# Altium schematic sheet Watt.SchDoc
size A4; SheetNumber: 1; SheetTotal: 1
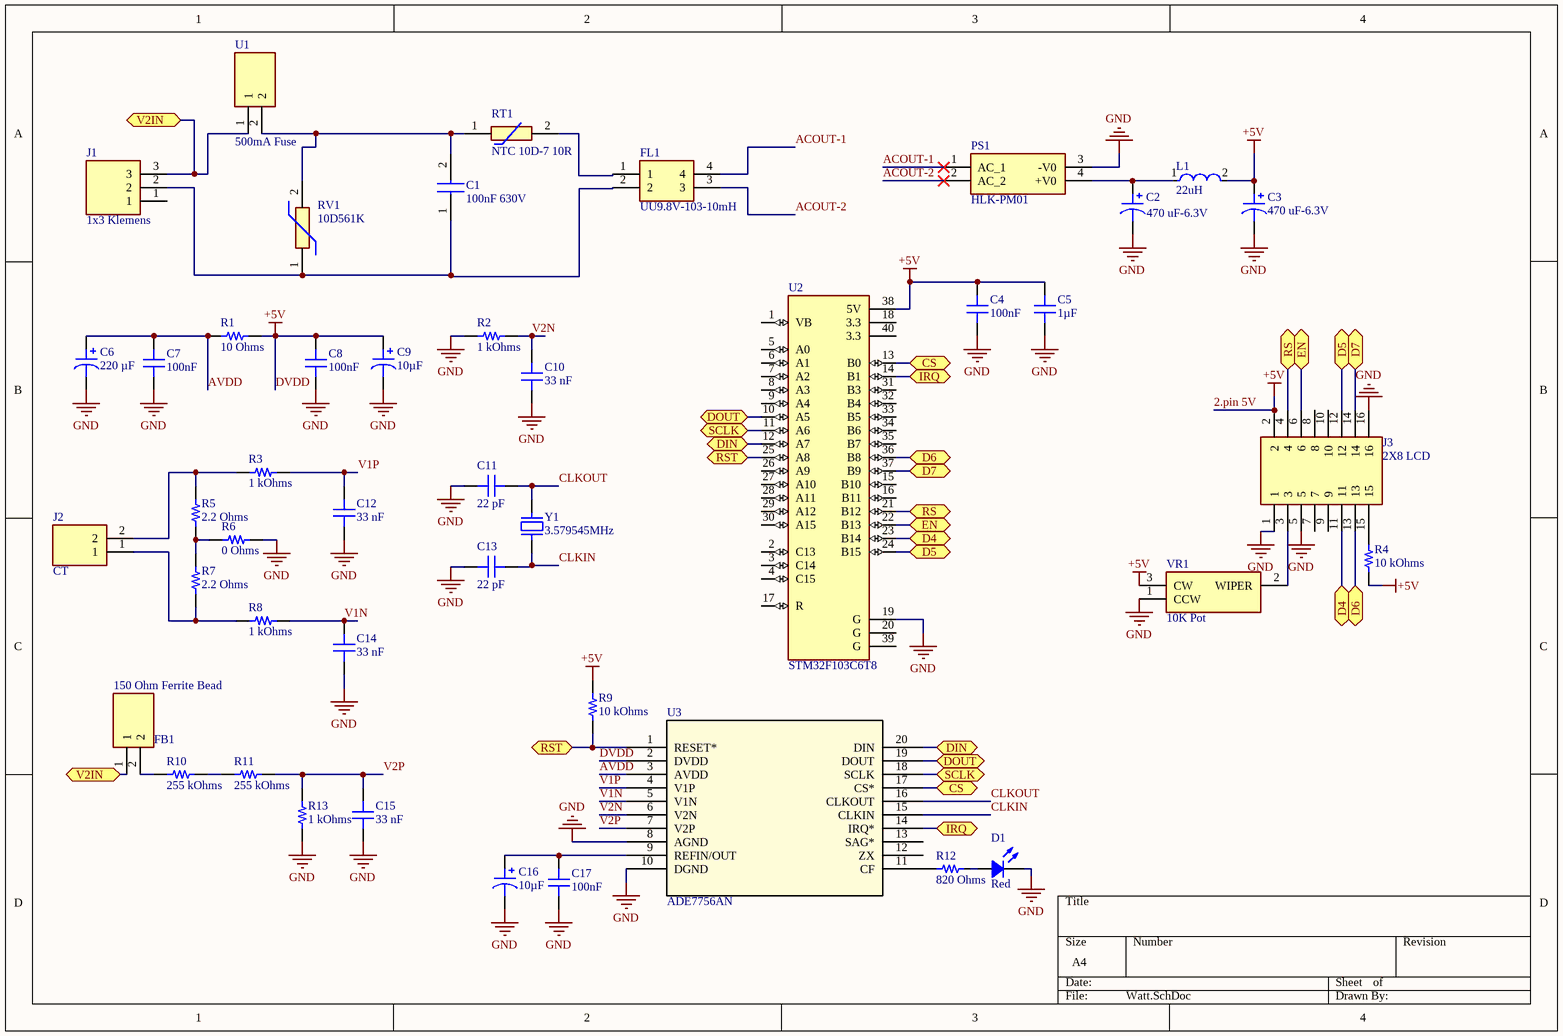
[diagram p0: Watt.SchDoc]

## Parts
C1  100nF 630V  [ECQE6104KF3]
C2  470 uF-6.3V  [CAP ALSMD 8.3MM H10.5MM]
C3  470 uF-6.3V  [CAP ALSMD 8.3MM H10.5MM]
C4  Capacitance: 100nF  [CAP 1206_3216 - 0.8MM]  (hidden comment: 0.1 µF)
C5  1µF  [CAP 1206_3216 - 1.0MM]
C6  220 µF  [CAP ALSMD POLY 5.3MM H6.0MM]
C7  Capacitance: 100nF  [CAP 1206_3216 - 0.8MM]  (hidden comment: 0.1 µF)
C8  Capacitance: 100nF  [CAP 1206_3216 - 0.8MM]  (hidden comment: 0.1 µF)
C9  10µF  [CAP POL 1206_3216]
C10  Capacitance: 33 nF  [CAP 1206_3216 - 0.8MM]  (hidden comment: 0.033 µF)
C11  22 pF  [CAP 0805_2012]
C12  Capacitance: 33 nF  [CAP 1206_3216 - 0.8MM]  (hidden comment: 0.033 µF)
C13  22 pF  [CAP 0805_2012]
C14  Capacitance: 33 nF  [CAP 1206_3216 - 0.8MM]  (hidden comment: 0.033 µF)
C15  Capacitance: 33 nF  [CAP 1206_3216 - 0.8MM]  (hidden comment: 0.033 µF)
C16  10µF  [CAP POL 1206_3216]
C17  Capacitance: 100nF  [CAP 1206_3216 - 0.8MM]  (hidden comment: 0.1 µF)
D1  Red  [LED 1206_3216 RED]
FB1  150 Ohm Ferrite Bead  [BEADC4516X185N]
FL1  UU9.8V-103-10mH  [SU9VF02100]
J1  1x3 Klemens  [YK3030323000G]
J2  CT  [YK3210203000G]
J3  2X8 LCD  [SHDR16W65P254_2X8_2794X880X900P]
L1  22uH  [FP-NR6028-MFG]
PS1  HLK-PM01  [HLKPM01]
R1  10 Ohms  [RES 1206_3216]
R2  1 kOhms  [RES 1206_3216]
R3  1 kOhms  [RES 1206_3216]
R4  10 kOhms  [RES 1206_3216]
R5  2.2 Ohms  [RES 1206_3216]
R6  0 Ohms  [RES 1206_3216]
R7  2.2 Ohms  [RES 1206_3216]
R8  1 kOhms  [RES 1206_3216]
R9  10 kOhms  [RES 1206_3216]
R10  255 kOhms  [RES 1206_3216]
R11  255 kOhms  [RES 1206_3216]
R12  820 Ohms  [RES 1206_3216]
R13  1 kOhms  [RES 1206_3216]
RT1  NTC 10D-7 10R  [MF72010D5]
RV1  10D561K  [MOV10D561KTR]
U1  500mA Fuse  [0PTF0078P]
U2  STM32F103C6T8  [MODULE_ZC323000]
U3  ADE7756AN  [N_20_ADI]
VR1  10K Pot  [3314J2102E]
Y1  3.579545MHz  [TXC 9C]

## Ports
CS (bidir), D4 (bidir), D5 (bidir), D6 (bidir), D7 (bidir), DIN (bidir), DOUT (bidir), EN (bidir), IRQ (bidir), RS (bidir), RST (bidir), SCLK (bidir), V2IN (bidir)

## Nets
2.pin 5V: C3.1 C4.2 C5.2 C8.2 C9.1 J3.2 L1.2 R1.2 R4.1 R9.2 U2.38(5V) U3.2(DVDD) VR1.3(CW)  [also labelled +5V, DVDD]
GND: C2.2 C3.2 C4.1 C5.1 C6.2 C7.1 C8.1 C9.2 C10.1 C11.2 C12.1 C13.2 C14.1 C15.1 C16.2 C17.1 D1.2 J3.1 J3.5 J3.16 PS1.3(-V0) R2.1 R6.2 R13.1 U2.19(G) U3.8(AGND) U3.10(DGND) VR1.1(CCW)
ACOUT-1: FL1.4 PS1.1(AC_1)
ACOUT-2: FL1.3 PS1.2(AC_2)
AVDD: C6.1 C7.2 R1.1 U3.3(AVDD)
CLKIN: C13.1 U3.15(CLKIN) Y1.1
CLKOUT: C11.1 U3.16(CLKOUT) Y1.2
CS: U2.13(B0) U3.17(CS*) ; port CS
D4: J3.11 U2.23(B14) ; port D4
D5: J3.12 U2.24(B15) ; port D5
D6: J3.13 U2.36(B8) ; port D6
D7: J3.14 U2.37(B9) ; port D7
DIN: U2.12(A7) U3.20(DIN) ; port DIN
DOUT: U2.10(A5) U3.19(DOUT) ; port DOUT
EN: J3.6 U2.22(B13) ; port EN
IRQ: U2.14(B1) U3.14(IRQ*) ; port IRQ
RS: J3.4 U2.21(B12) ; port RS
RST: R9.1 U2.25(A8) U3.1(RESET*) ; port RST
SCLK: U2.11(A6) U3.18(SCLK) ; port SCLK
V1N: C14.2 R8.2 U3.5(V1N)
V1P: C12.2 R3.2 U3.4(V1P)
V2IN: FB1.1 J1.3 U1.1 ; port V2IN
V2N: C10.2 R2.2 U3.6(V2N)
V2P: C15.2 R11.2 R13.2 U3.7(V2P)
NetC1_1: C1.1 FL1.2 J1.2 RV1.1
NetC1_2: C1.2 RT1.1 RV1.2 U1.2
NetC2_1: C2.1 L1.1 PS1.4(+V0)
NetC16_1: C16.1 C17.2 U3.9(REFIN/OUT)
NetD1_1: D1.1 R12.2
NetFB1_2: FB1.2 R10.1
NetFL1_1: FL1.1 RT1.2
NetJ2_1: J2.1 R7.2 R8.1
NetJ2_2: J2.2 R3.1 R5.1
NetJ3_3: J3.3 VR1.2(WIPER)
NetJ3_15: J3.15 R4.2
NetR5_2: R5.2 R6.1 R7.1
NetR10_2: R10.2 R11.1
NetR12_1: R12.1 U3.11(CF)

Not connected (* = marked no-connect by the designer): J1 1; J3 7 8 9 10; U2 1(VB) 2(C13) 3(C14) 4(C15) 5(A0) 6(A1) 7(A2) 8(A3) 9(A4) 15(B10) 16(B11) 17(R) 18(3.3) 20(G) 26(A9) 27(A10) 28(A11) 29(A12) 30(A15) 31(B3) 32(B4) 33(B5) 34(B6) 35(B7) 39(G) 40(3.3); U3 12(ZX) 13(SAG*)

## Library data of the parts
C1 = ECQ-E6104KF3: Capacitor; Manufacturer_Name: Panasonic; Datasheet Link: https://industrial.panasonic.com/ww/products/pt/film-cap-electroequip/models/ECQE6104JFW; Height: 19mm; Manufacturer_Part_Number: ECQ-E6104KF3; Mouser Part Number: 667-ECQ-E6104KF3; Mouser Price/Stock: https://www.mouser.co.uk/ProductDetail/Panasonic/ECQ-E6104KF3?qs=9ouE0kzBZ2ok8zr8PFf9Hw%3D%3D
C2 C3 = 10SKV470M8X10.5: CAP ALUM 470UF 20% 10V SMD; manufacturer: Rubycon; Capacitance: 470 µF; Lifetime @ Temp.: 1000 Hrs @ 105°C; Polarization: Polar; Ripple Current @ High Frequency: 252 mA @ 10 kHz; Ripple Current @ Low Frequency: 210 mA @ 120 Hz; Surface Mount Land Size: 0.327" L x 0.327" W (8.30mm x 8.30mm); value: 470 µF; Part Number: 10SKV470M8X10.5; Applications: General Purpose; componentlink1description: Datasheet; componentlink1url: http://www.rubycon.co.jp/en/catalog/e_pdfs/aluminum/e_SKV.pdf; componentlink2description: DigiKey Link; componentlink2url: https://www.digikey.com/en/products/detail/rubycon/10SKV470M8X10-5/3568721; Device Package: Radial, Can - SMD; Height - Seated (Max): 0.413" (10.50mm); lastupdated: 3.06.2024 20:15:49; Lifecycle Status: Active; Minimum Order: 1; Mounting Type: Surface Mount; Operating Temperature: -55°C ~ 105°C; Package / Case: Radial, Can - SMD; packaging: TapeAndReel; partid: 7459; Part Status: Active; price: 0.18; series: SKV; Size / Dimension: 0.315" Dia (8.00mm); Supplier 1: DigiKey; Supplier Part Number 1: 1189-3067-1-ND; Tolerance: ±20%; Voltage - Rated: 10 V
C4 C7 C8 C17 = CC1206MRY5V9BB104: CAP CER 0.1UF 50V Y5V 1206; manufacturer: Yageo; Temperature Coefficient: Y5V (F); Tolerance: ±20%; Part Number: CC1206MRY5V9BB104; Applications: General Purpose; componentlink1description: Datasheet; componentlink1url: http://www.yageo.com/documents/recent/UPY-GPHC_Y5V_6.3V-to-50V_8.pdf; componentlink2description: DigiKey Link; componentlink2url: https://www.digikey.com/en/products/detail/yageo/CC1206MRY5V9BB104/5884674; Device Package: 1206 (3216 Metric); lastupdated: 4.06.2024 19:10:39; Lifecycle Status: Active; Minimum Order: 1; Mounting Type: Surface Mount, MLCC; Operating Temperature: -30°C ~ 85°C; Package / Case: 1206 (3216 Metric); packaging: TapeAndReel; partid: 18711; Part Status: Active; price: 0.04; series: CC; Size / Dimension: 0.126" L x 0.063" W (3.20mm x 1.60mm); Supplier 1: DigiKey; Supplier Part Number 1: 311-4504-1-ND; Thickness (Max): 0.028" (0.70mm); value: 0.1 µF; Voltage - Rated: 50V
C5 = 12065C105K4Z2A: CAP CER 1UF 50V X7R 1206; manufacturer: AVX Corporation; Tolerance: ±10%; Part Number: 12065C105K4Z2A; Capacitance: 1µF; Applications: Automotive, Boardflex Sensitive; componentlink1description: Datasheet; componentlink1url: http://datasheets.avx.com/AutoMLCC.pdf; componentlink2description: DigiKey Link; componentlink2url: http://digikey.com/product-detail/en/avx-corporation/12065C105K4Z2A/478-10886-1-ND/7536455; Device Package: 1206 (3216 Metric); Features: Soft Termination; lastupdated: 2.09.2020 01:05:06; Lifecycle Status: Active; Minimum Order: 1; Mounting Type: Surface Mount, MLCC; Operating Temperature: -55°C ~ 125°C; Package / Case: 1206 (3216 Metric); packaging: TapeAndReel; partid: 18944; Part Status: Active; price: 0.12; Ratings: AEC-Q200; series: FLEXITERM®; Size / Dimension: 0.126" L x 0.063" W (3.20mm x 1.60mm); Supplier 1: DigiKey; Supplier Part Number 1: 478-10886-1-ND; Temperature Coefficient: X7R; Thickness (Max): 0.037" (0.94mm); value: 1µF; Voltage - Rated: 50V
C6 = 6SVPE220MW: CAP ALUM POLY 220UF 20% 6.3V SMD; manufacturer: Panasonic Electronic Components; ESR (Equivalent Series Resistance): 15mOhm; Lifetime @ Temp.: 2000 Hrs @ 105°C; Ripple Current @ High Frequency: 3.15 A @ 100 kHz; Ripple Current @ Low Frequency: 157.5 mA @ 120 Hz; Surface Mount Land Size: 0.209" L x 0.209" W (5.30mm x 5.30mm); Type: Polymer; Part Number: 6SVPE220MW; Applications: General Purpose; Capacitance: 220 µF; componentlink1description: Datasheet; componentlink1url: http://industrial.panasonic.com/www-cgi/jvcr13pz.cgi?E+CI+4+AAB8002+6SVPE220MW+8+WW; componentlink2description: DigiKey Link; componentlink2url: https://www.digikey.com/en/products/detail/panasonic-electronic-components/6SVPE220MW/4209271; Device Package: Radial, Can - SMD; Height - Seated (Max): 0.236" (6.00mm); lastupdated: 3.06.2024 20:02:32; Lifecycle Status: Active; Minimum Order: 1; Mounting Type: Surface Mount; Operating Temperature: -55°C ~ 105°C; Package / Case: Radial, Can - SMD; packaging: TapeAndReel; partid: 1960; Part Status: Active; price: 0.30; series: OS-CON™, SVPE; Size / Dimension: 0.197" Dia (5.00mm); Supplier 1: DigiKey; Supplier Part Number 1: P16836CT-ND; Tolerance: ±20%; value: 220 µF; Voltage - Rated: 6.3 V
C9 C16 = THJA106K006RJN: CAP TANT 10UF 10% 6.3V 1206; manufacturer: AVX Corporation; Manufacturer Size Code: A; ESR (Equivalent Series Resistance): 2.2Ohm; Type: Molded; Part Number: THJA106K006RJN; Value: 10µF; Capacitance: 10µF; componentlink1description: Datasheet; componentlink1url: http://datasheets.avx.com/THJ.pdf; componentlink2description: DigiKey Link; componentlink2url: http://digikey.com/product-detail/en/avx-corporation/THJA106K006RJN/478-7574-1-ND/3660378; Device Package: 1206 (3216 Metric); Features: General Purpose; Height - Seated (Max): 0.063" (1.60mm); lastupdated: 2.09.2020 01:15:59; Lifecycle Status: Active; Minimum Order: 1; Mounting Type: Surface Mount; Operating Temperature: -55°C ~ 175°C; Package / Case: 1206 (3216 Metric); packaging: TapeAndReel; partid: 220; Part Status: Active; price: 0.16; series: THJ; Size / Dimension: 0.126" L x 0.063" W (3.20mm x 1.60mm); Supplier 1: DigiKey; Supplier Part Number 1: 478-7574-1-ND; Tolerance: ±10%; Voltage - Rated: 6.3V
C10 C12 C14 C15 = C1206F333K5RAC7800: CAP CER 0.033UF 50V X7R 1206; manufacturer: KEMET; Tolerance: ±10%; Part Number: C1206F333K5RAC7800; Applications: General Purpose; componentlink1description: Datasheet; componentlink1url: https://api.kemet.com/component-edge/download/datasheet/C1206F333K5RAC7800.pdf; componentlink2description: DigiKey Link; componentlink2url: https://www.digikey.com/en/products/detail/kemet/C1206F333K5RAC7800/9925533; Device Package: 1206 (3216 Metric); Features: Open Mode; lastupdated: 4.06.2024 19:10:40; Lifecycle Status: Active; Minimum Order: 1; Mounting Type: Surface Mount, MLCC; Operating Temperature: -55°C ~ 125°C; Package / Case: 1206 (3216 Metric); packaging: TapeAndReel; partid: 18898; Part Status: Active; price: 0.17; series: SMD Comm X7R FO; Size / Dimension: 0.126" L x 0.063" W (3.20mm x 1.60mm); Supplier 1: DigiKey; Supplier Part Number 1: 399-20241-1-ND; Temperature Coefficient: X7R; Thickness (Max): 0.043" (1.10mm); value: 0.033 µF; Voltage - Rated: 50V
C11 C13 = C0805C220J5GACAUTO: CAP CER 22PF 50V C0G/NP0 0805; manufacturer: KEMET; Temperature Coefficient: C0G, NP0; Tolerance: ±5%; Part Number: C0805C220J5GACAUTO; Capacitance: 22 pF; Applications: Automotive; componentlink1description: Datasheet; componentlink1url: https://api.kemet.com/component-edge/download/datasheet/C0805C220J5GACAUTO.pdf; componentlink2description: DigiKey Link; componentlink2url: https://www.digikey.com/en/products/detail/kemet/C0805C220J5GACAUTO/3314930; Device Package: 0805 (2012 Metric); Features: Low ESL; lastupdated: 9.02.2024 20:16:09; Lifecycle Status: Active; Minimum Order: 1; Mounting Type: Surface Mount, MLCC; Operating Temperature: -55°C ~ 125°C; Package / Case: 0805 (2012 Metric); packaging: TapeAndReel; partid: 2537; Part Status: Active; price: 0.01; Ratings: AEC-Q200; series: SMD Auto C0G; Size / Dimension: 0.079" L x 0.049" W (2.00mm x 1.25mm); Supplier 1: DigiKey; Supplier Part Number 1: 399-6937-1-ND; Thickness (Max): 0.035" (0.88mm); value: 22 pF; Voltage - Rated: 50V
D1 = CMD11-21VRC/TR8: LED RED CLEAR 1206 SMD; Manufacturer: Visual Communications Company - VCC; Configuration: Standard; Current - Test: 20mA; Lens Color: 1.50mm; Lens Size: 1.10mm Dia; Lens Style: Round with Flat Top; Millicandela Rating: 6mcd; Viewing Angle: 20°; Voltage - Forward (Vf) (Typ): 2V; Wavelength - Peak: 640nm; Part Number: CMD11-21VRC/TR8; Color: Red; ComponentLink1Description: Datasheet; ComponentLink1URL: https://vcclite.com/wp-content/uploads/wpallimport/files/files/CMD11-21%20SMT%20LEDs%201206%20Package%20Size.pdf; ComponentLink2Description: DigiKey Link; ComponentLink2URL: https://www.digikey.com/en/products/detail/visual-communications-company-vcc/CMD11-21VRC-TR8/254829; Device Package: 1206 (3216 Metric); Height (Max): 1.50mm; LastUpdated: 3.06.2024 20:00:41; Lens Transparency: Clear; Lifecycle Status: Active; Minimum Order: 1; Mounting Type: Surface Mount; Package / Case: 1206 (3216 Metric); Packaging: TapeAndReel; PartId: 184; Part Status: Active; Price: 0.24; Series: -; Size / Dimension: 3.00mm L x 1.50mm W; Supplier 1: DigiKey; Supplier Part Number 1: L62001CT-ND; Supplier Device Package: 1206; Value: Red
FB1 = LI1806C151R-10: Ferrite Bead; Manufacturer_Name: Laird-Signal Integrity Products; Datasheet Link: https://assets.lairdtech.com/home/brandworld/files/LI1806C151R-10.pdf; Height: 1.85mm; Manufacturer_Part_Number: LI1806C151R-10
FL1 = SU9VF-02100: Filter; Manufacturer_Name: KEMET; Datasheet Link: https://content.kemet.com/datasheets/KEM_LF0017_SU9VF-9HF.pdf; Height: 17mm; Manufacturer_Part_Number: SU9VF-02100; Mouser Part Number: 80-SU9VF-02100; Mouser Price/Stock: https://www.mouser.co.uk/ProductDetail/KEMET/SU9VF-02100?qs=BenOyfdfArr5wEjIaShULA%3D%3D; Arrow Part Number: SU9VF-02100; Arrow Price/Stock: https://www.arrow.com/en/products/su9vf-02100/kemet-corporation?region=nac
J1 = YK3030323000G: Connector; Manufacturer_Name: Amphenol; Datasheet Link: http://www.anytek.com.tw/UserUpFiles/20121222/mLK3Fon9ty0A.pdf; Height: 15.6mm; Manufacturer_Part_Number: YK3030323000G; Mouser Part Number: 649-YK30303230J0G; Mouser Price/Stock: https://www.mouser.co.uk/ProductDetail/Amphenol-Anytek/YK3030323000G?qs=Mv7BduZupUh63LOTVB5zVA%3D%3D
J2 = YK3210203000G: Connector; Manufacturer_Name: Amphenol; Datasheet Link: https://eu.mouser.com/datasheet/2/18/7Pva_Bm2hlSl-1379478.pdf; Height: 15.9mm; Manufacturer_Part_Number: YK3210203000G; Mouser Part Number: 649-YK32102030J0G; Mouser Price/Stock: https://www.mouser.co.uk/ProductDetail/Amphenol-Anytek/YK3210203000G?qs=Mv7BduZupUi0q03DSkdXZw%3D%3D
J3 = 3020-16-0100-00: Connector; Manufacturer_Name: CNC Tech; Datasheet Link: http://cnctech.us/pdfs/3020-XX-0100-00.pdf; Height: 9mm; Manufacturer_Part_Number: 3020-16-0100-00; Arrow Part Number: 3020-16-0100-00; Arrow Price/Stock: https://www.arrow.com/en/products/3020-16-0100-00/cnc-tech-llc?region=nac
L1 = CMP-14484-000420-1: SMD Power Inductors 22uH ±20% 1.3A 0.1755Ω; Shielding: Shielded; Max DC Current: 1.4A; Core Material: Ferrite; DC Resistance (DCR): 175.5mR; Test Frequency: 100kHz; Self Resonant Frequency: 12MHz; Resistor Type: Wirewound; Inductance Tolerance: 20%; Package Quantity: 2000; Length: 0.236inch; Saturation Current: 1.3A; Case/Package: 2424; Series: NR; Min Operating Temperature: -25°C; Halogen Free: Halogen Free; RoHS Compliant: Yes; Height: 2.8mm; Mount: Surface Mount; Number of Pins: 2; Packaging: Tape and Reel; Width: 6mm; Inductance: 22uH; RMS Current (Irms): 1.4A; Max Operating Temperature: 120°C; Height - Seated (Max): 0.11inch; Tolerance: 20%; Current Rating: 1.4A; Termination: SMD/SMT
PS1 = HLK-PM01: Power Supply; Manufacturer_Name: Hi-Link; Datasheet Link: https://datasheet.lcsc.com/szlcsc/1906201102_HI-LINK-HLK-PM03_C209904.pdf; Height: 15mm; Manufacturer_Part_Number: HLK-PM01
R1 = RNCS1206BKE10R0: RES 10 OHM 0.1% 1/8W 1206; Manufacturer: Stackpole Electronics Inc; Power (Watts): 0.125W, 1/8W; Temperature Coefficient: ±25ppm/°C; Part Number: RNCS1206BKE10R0; ComponentLink1Description: Datasheet; ComponentLink1URL: https://www.seielect.com/catalog/sei-rncs_rnch.pdf; ComponentLink2Description: DigiKey Link; ComponentLink2URL: https://www.digikey.com/en/products/detail/stackpole-electronics-inc/RNCS1206BKE10R0/1801459; Composition: Thin Film; Device Package: 1206 (3216 Metric); Features: Anti-Corrosive, Automotive AEC-Q200, Moisture Resistant; Height - Seated (Max): 0.026" (0.65mm); LastUpdated: 9.02.2024 20:54:46; Lifecycle Status: Active; Minimum Order: 1; Number of Terminations: 2; Operating Temperature: -55°C ~ 155°C; Package / Case: 1206 (3216 Metric); Packaging: TapeAndReel; PartId: 26855; Part Status: Active; Price: 0.08; Ratings: AEC-Q200; Resistance: 10 Ohms; Series: RNCS; Size / Dimension: 0.120" L x 0.061" W (3.05mm x 1.55mm); Supplier 1: DigiKey; Supplier Part Number 1: RNCS1206BKE10R0CT-ND; Supplier Device Package: 1206; Tolerance: ±0.1%; Value: 10 Ohms
R2 R3 R8 R13 = RNCS1206BKE1K00: RES 1K OHM 0.1% 1/8W 1206; Manufacturer: Stackpole Electronics Inc; Power (Watts): 0.125W, 1/8W; Temperature Coefficient: ±25ppm/°C; Part Number: RNCS1206BKE1K00; ComponentLink1Description: Datasheet; ComponentLink1URL: https://www.seielect.com/catalog/sei-rncs_rnch.pdf; ComponentLink2Description: DigiKey Link; ComponentLink2URL: https://www.digikey.com/en/products/detail/stackpole-electronics-inc/RNCS1206BKE1K00/1800333; Composition: Thin Film; Device Package: 1206 (3216 Metric); Features: Anti-Corrosive, Automotive AEC-Q200, Moisture Resistant; Height - Seated (Max): 0.026" (0.65mm); LastUpdated: 9.02.2024 20:54:46; Lifecycle Status: Active; Minimum Order: 1; Number of Terminations: 2; Operating Temperature: -55°C ~ 155°C; Package / Case: 1206 (3216 Metric); Packaging: TapeAndReel; PartId: 26856; Part Status: Active; Price: 0.08; Ratings: AEC-Q200; Resistance: 1 kOhms; Series: RNCS; Size / Dimension: 0.120" L x 0.061" W (3.05mm x 1.55mm); Supplier 1: DigiKey; Supplier Part Number 1: RNCS1206BKE1K00CT-ND; Supplier Device Package: 1206; Tolerance: ±0.1%; Value: 1 kOhms
R4 R9 = CRGCQ1206F10K: RES 10K OHM 1% 1/4W 1206; Manufacturer: TE Connectivity Passive Product; Power (Watts): 0.25W, 1/4W; Temperature Coefficient: ±100ppm/°C; Part Number: CRGCQ1206F10K; ComponentLink1Description: Datasheet; ComponentLink1URL: https://www.te.com/commerce/DocumentDelivery/DDEController?Action=srchrtrv&DocNm=1773204-3&DocType=DS&DocLang=English; ComponentLink2Description: DigiKey Link; ComponentLink2URL: https://www.digikey.com/en/products/detail/te-connectivity-passive-product/CRGCQ1206F10K/8576424; Composition: Thick Film; Device Package: 1206 (3216 Metric); Features: Automotive AEC-Q200, Moisture Resistant; Height - Seated (Max): 0.026" (0.65mm); LastUpdated: 9.02.2024 20:54:44; Lifecycle Status: Active; Minimum Order: 1; Number of Terminations: 2; Operating Temperature: -55°C ~ 155°C; Package / Case: 1206 (3216 Metric); Packaging: TapeAndReel; PartId: 27005; Part Status: Active; Price: 0.01; Ratings: AEC-Q200; Resistance: 10 kOhms; Series: CRGCQ; Size / Dimension: 0.122" L x 0.061" W (3.10mm x 1.55mm); Supplier 1: DigiKey; Supplier Part Number 1: A129822CT-ND; Supplier Device Package: 1206; Tolerance: ±1%; Value: 10 kOhms
R5 R7 = RMCF1206FT2R20: RES 2.2 OHM 1% 1/4W 1206; Manufacturer: Stackpole Electronics Inc; Power (Watts): 0.25W, 1/4W; Temperature Coefficient: ±200ppm/°C; Part Number: RMCF1206FT2R20; ComponentLink1Description: Datasheet; ComponentLink1URL: https://www.seielect.com/catalog/sei-rmcf_rmcp.pdf; ComponentLink2Description: DigiKey Link; ComponentLink2URL: https://www.digikey.com/en/products/detail/stackpole-electronics-inc/RMCF1206FT2R20/1759711; Composition: Thick Film; Device Package: 1206 (3216 Metric); Features: Automotive AEC-Q200; Height - Seated (Max): 0.028" (0.70mm); LastUpdated: 9.02.2024 20:54:28; Lifecycle Status: Active; Minimum Order: 1; Number of Terminations: 2; Operating Temperature: -55°C ~ 155°C; Package / Case: 1206 (3216 Metric); Packaging: TapeAndReel; PartId: 30998; Part Status: Active; Price: 0.01; Ratings: AEC-Q200; Resistance: 2.2 Ohms; Series: RMCF; Size / Dimension: 0.126" L x 0.063" W (3.20mm x 1.60mm); Supplier 1: DigiKey; Supplier Part Number 1: RMCF1206FT2R20CT-ND; Supplier Device Package: 1206; Tolerance: ±1%; Value: 2.2 Ohms
R6 = TLRZ2BTTD: RES 0 OHM JUMPER 1206; Manufacturer: KOA Speer Electronics, Inc.; Part Number: TLRZ2BTTD; ComponentLink1Description: Datasheet; ComponentLink1URL: http://www.koaspeer.com/catimages/Products/TLRZ/TLRZ.pdf; ComponentLink2Description: DigiKey Link; ComponentLink2URL: https://www.digikey.com/en/products/detail/koa-speer-electronics-inc/TLRZ2BTTD/9845495; Composition: Metal Element; Device Package: 1206 (3216 Metric); Features: Automotive AEC-Q200, Current Sense; Height - Seated (Max): 0.022" (0.55mm); LastUpdated: 9.02.2024 20:54:46; Lifecycle Status: Active; Minimum Order: 1; Number of Terminations: 2; Operating Temperature: -55°C ~ 170°C; Package / Case: 1206 (3216 Metric); Packaging: TapeAndReel; PartId: 26853; Part Status: Active; Price: 0.09; Ratings: AEC-Q200; Resistance: 0 Ohms; Series: TLRZ; Size / Dimension: 0.126" L x 0.063" W (3.20mm x 1.60mm); Supplier 1: DigiKey; Supplier Part Number 1: 2019-TLRZ2BTTDCT-ND; Supplier Device Package: 1206; Tolerance: Jumper; Value: 0 Ohms
R10 R11 = RMCF1206FT255K: RES 255K OHM 1% 1/4W 1206; Manufacturer: Stackpole Electronics Inc; Power (Watts): 0.25W, 1/4W; Temperature Coefficient: ±100ppm/°C; Part Number: RMCF1206FT255K; ComponentLink1Description: Datasheet; ComponentLink1URL: https://www.seielect.com/catalog/sei-rmcf_rmcp.pdf; ComponentLink2Description: DigiKey Link; ComponentLink2URL: https://www.digikey.com/en/products/detail/stackpole-electronics-inc/RMCF1206FT255K/1759971; Composition: Thick Film; Device Package: 1206 (3216 Metric); Features: Automotive AEC-Q200; Height - Seated (Max): 0.028" (0.70mm); LastUpdated: 9.02.2024 20:54:42; Lifecycle Status: Active; Minimum Order: 1; Number of Terminations: 2; Operating Temperature: -55°C ~ 155°C; Package / Case: 1206 (3216 Metric); Packaging: TapeAndReel; PartId: 27366; Part Status: Active; Price: 0.01; Ratings: AEC-Q200; Resistance: 255 kOhms; Series: RMCF; Size / Dimension: 0.126" L x 0.063" W (3.20mm x 1.60mm); Supplier 1: DigiKey; Supplier Part Number 1: 738-RMCF1206FT255KCT-ND; Supplier Device Package: 1206; Tolerance: ±1%; Value: 255 kOhms
R12 = CRGCQ1206F820R: RES 820 OHM 1% 1/4W 1206; Manufacturer: TE Connectivity Passive Product; Power (Watts): 0.25W, 1/4W; Temperature Coefficient: ±100ppm/°C; Part Number: CRGCQ1206F820R; ComponentLink1Description: Datasheet; ComponentLink1URL: https://www.te.com/commerce/DocumentDelivery/DDEController?Action=srchrtrv&DocNm=1773204-3&DocType=DS&DocLang=English; ComponentLink2Description: DigiKey Link; ComponentLink2URL: https://www.digikey.com/en/products/detail/te-connectivity-passive-product/CRGCQ1206F820R/8576411; Composition: Thick Film; Device Package: 1206 (3216 Metric); Features: Automotive AEC-Q200, Moisture Resistant; Height - Seated (Max): 0.026" (0.65mm); LastUpdated: 9.02.2024 20:54:44; Lifecycle Status: Active; Minimum Order: 1; Number of Terminations: 2; Operating Temperature: -55°C ~ 155°C; Package / Case: 1206 (3216 Metric); Packaging: TapeAndReel; PartId: 26992; Part Status: Active; Price: 0.01; Ratings: AEC-Q200; Resistance: 820 Ohms; Series: CRGCQ; Size / Dimension: 0.122" L x 0.061" W (3.10mm x 1.55mm); Supplier 1: DigiKey; Supplier Part Number 1: A129809CT-ND; Supplier Device Package: 1206; Tolerance: ±1%; Value: 820 Ohms
RT1 = MF72-010D5: Thermistor; Manufacturer_Name: Cantherm; Datasheet Link: https://www.cantherm.com/wp-content/uploads/2018/08/MF72_AUG_2018.pdf; Height: 11mm; Manufacturer_Part_Number: MF72-010D5
RV1 = MOV-10D561KTR: Varistor; Manufacturer_Name: Bourns; Datasheet Link: https://www.bourns.com/docs/Product-Datasheets/MOV10D.pdf; Height: 15.5mm; Manufacturer_Part_Number: MOV-10D561KTR; Mouser Part Number: 652-MOV-10D561KTR; Mouser Price/Stock: https://www.mouser.co.uk/ProductDetail/Bourns/MOV-10D561KTR?qs=lgttKnAd%252B2CzitieoxdOpg%3D%3D; Arrow Part Number: MOV-10D561KTR; Arrow Price/Stock: https://www.arrow.com/en/products/mov-10d561ktr/bourns?utm_currency=USD&region=nac
U1 = 0PTF0078P: Undefined or Miscellaneous; Manufacturer_Name: LITTELFUSE; Datasheet Link: https://media.digikey.com/pdf/Data%20Sheets/Littelfuse%20PDFs/PTF075_77_78.pdf; Height: 11.5mm; Manufacturer_Part_Number: 0PTF0078P; Mouser Part Number: 576-0PTF0078P; Mouser Price/Stock: https://www.mouser.co.uk/ProductDetail/Littelfuse/0PTF0078P?qs=Co4VkB5J4%2Fsczy6gG8s%2FsA%3D%3D; Arrow Part Number: 0PTF0078P; Arrow Price/Stock: https://www.arrow.com/en/products/0ptf0078p/littelfuse?utm_currency=USD&region=europe
U2 = ZC323000: STM32F103C8T6 ARM STM32 Minimum System Development Board Module For Arduino; Package: None; MP: ZC323000; Value: *; Availability: Unavailable; Price: None
U3 = ADE7756AN: No Description Available; Mfr_Name: Analog Devices Inc; RefDes: RefDes; Type: Type
VR1 = 3314J-2-103E: Variable Resistor; Manufacturer_Name: Bourns; Datasheet Link: https://componentsearchengine.com/Datasheets/1/3314J-2-102E.pdf; Height: 2.55mm; Manufacturer_Part_Number: 3314J-2-103E; Mouser Part Number: 652-3314J-2-103E; Mouser Price/Stock: https://www.mouser.co.uk/ProductDetail/Bourns/3314J-2-103E?qs=eZFUMUGMTB7dPQMBqmZxfA%3D%3D; Arrow Part Number: 3314J-2-103E; Arrow Price/Stock: https://www.arrow.com/en/products/3314j-2-103e/bourns?region=europe
Y1 = 9C-3.579545MAAJ-T: CRYSTAL 3.579545MHZ 18PF SMD; Manufacturer: TXC CORPORATION; ESR (Equivalent Series Resistance): 200 Ohms; Frequency Stability: ±30ppm; Operating Mode: Fundamental; Part Number: 9C-3.579545MAAJ-T; ComponentLink1Description: Datasheet; ComponentLink1URL: http://www.txccorp.com/download/products/quartz_crystals/2015TXC_9C_32.pdf; ComponentLink2Description: DigiKey Link; ComponentLink2URL: http://digikey.com/product-detail/en/txc-corporation/9C-3.579545MAAJ-T/887-1040-1-ND/2118917; Frequency: 3.579545MHz; Frequency Tolerance: ±30ppm; Height - Seated (Max): 0.161" (4.10mm); LastUpdated: 3.06.2024 20:02:24; Lifecycle Status: Active; Load Capacitance: 18pF; Minimum Order: 1; Mounting Type: Surface Mount; Operating Temperature: -20°C ~ 70°C; Package / Case: HC-49/US; Packaging: TapeAndReel; PartId: 711; Part Status: Active; Price: 0.22; Series: 9C; Size / Dimension: 0.449" L x 0.189" W (11.40mm x 4.80mm); Supplier 1: DigiKey; Supplier Part Number 1: 887-1040-1-ND; Type: MHz Crystal; Value: 3.579545MHz